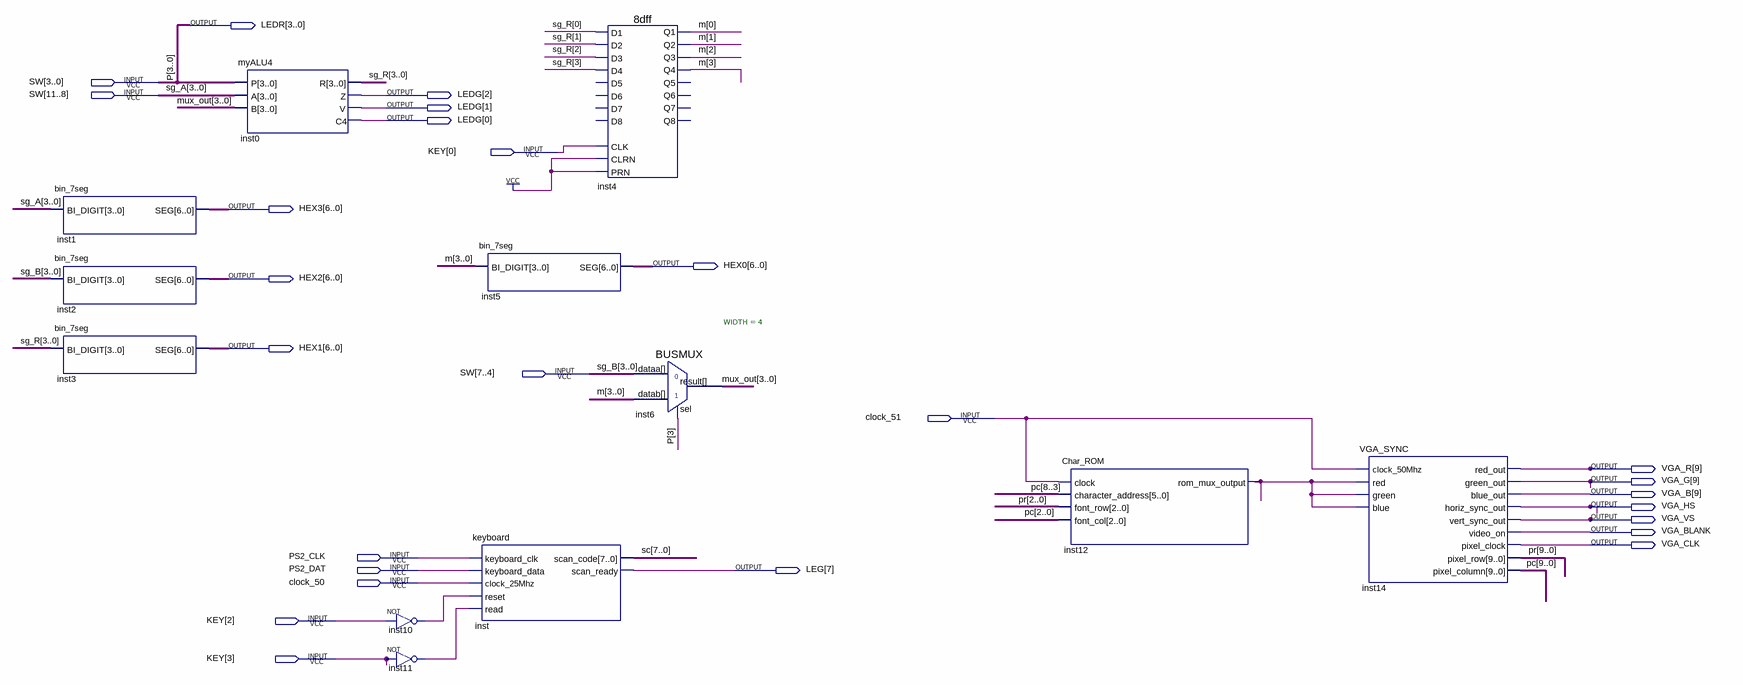
[diagram p0: schematic sheet]
// Quartus schematic Calculator.bdf as structural Verilog: 12 symbols, 26 pins
module Calculator (
  input  [11:0] SW,
  input  [3:0] KEY,
  input  clock_51,
  input  PS2_CLK,
  input  PS2_DAT,
  input  clock_50,
  output [3:0] LEDR,
  output [2:0] LEDG,
  output [6:0] HEX3,
  output [6:0] HEX0,
  output [6:0] HEX2,
  output [6:0] HEX1,
  output [9:9] VGA_R,
  output [9:9] VGA_G,
  output [9:9] VGA_B,
  output VGA_HS,
  output VGA_VS,
  output VGA_BLANK,
  output VGA_CLK,
  output [7:7] LEG
);

  wire inst10_out, inst11_out, inst12_rom_mux_output;
  wire [3:0] m, mux_out, sg_R;
  wire [7:0] sc;
  wire [9:0] pc, pr;

  bin_7seg inst1 (.BI_DIGIT(SW[11:8]), .SEG(HEX3));
  bin_7seg inst2 (.BI_DIGIT(SW[7:4]), .SEG(HEX2));
  bin_7seg inst3 (.BI_DIGIT(sg_R), .SEG(HEX1));
  myALU4 inst0 (.P(SW[3:0]), .A(SW[11:8]), .B(mux_out), .R(sg_R), .Z(LEDG[2]), .V(LEDG[1]), .C4(LEDG[0]));
  not inst10 (inst10_out, KEY[2]);
  not inst11 (inst11_out, KEY[3]);
  bin_7seg inst5 (.BI_DIGIT(m), .SEG(HEX0));
  keyboard inst (
    .keyboard_clk(PS2_CLK), .keyboard_data(PS2_DAT), .clock_25Mhz(clock_50), .reset(inst10_out),
    .read(inst11_out), .scan_code(sc), .scan_ready(LEG[7]));
  \8dff  inst4 (
    .D4(sg_R[3]), .D3(sg_R[2]), .PRN(1'b1), .CLK(KEY[0]), .CLRN(1'b1), .D2(sg_R[1]), .D1(sg_R[0]), .Q1(m[0]),
    .Q4(m[3]), .Q3(m[2]), .Q2(m[1]));  // open: D5, D8, D7, D6, Q8, Q5, Q6, Q7
  BUSMUX #(.WIDTH(4)) inst6 (.datab(m), .sel(SW[3]), .dataa(SW[7:4]), .result(mux_out));
  Char_ROM inst12 (
    .clock(clock_51), .character_address(pc[8:3]), .font_row(pr[2:0]), .font_col(pc[2:0]),
    .rom_mux_output(inst12_rom_mux_output));
  VGA_SYNC inst14 (
    .clock_50Mhz(clock_51), .red(inst12_rom_mux_output), .green(inst12_rom_mux_output),
    .blue(inst12_rom_mux_output), .red_out(VGA_R[9]), .green_out(VGA_G[9]), .blue_out(VGA_B[9]),
    .horiz_sync_out(VGA_HS), .vert_sync_out(VGA_VS), .video_on(VGA_BLANK), .pixel_clock(VGA_CLK),
    .pixel_row(pr), .pixel_column(pc));

  assign LEDR = SW[3:0];

  // Other names for the same wires on the sheet: P[3:0] = SW[3:0]; sg_A[3:0] = SW[11:8]; sg_B[3:0] = SW[7:4]
endmodule
